# Altium project RF-Hub-v1.0.PrjPcb (part 1 of 4)
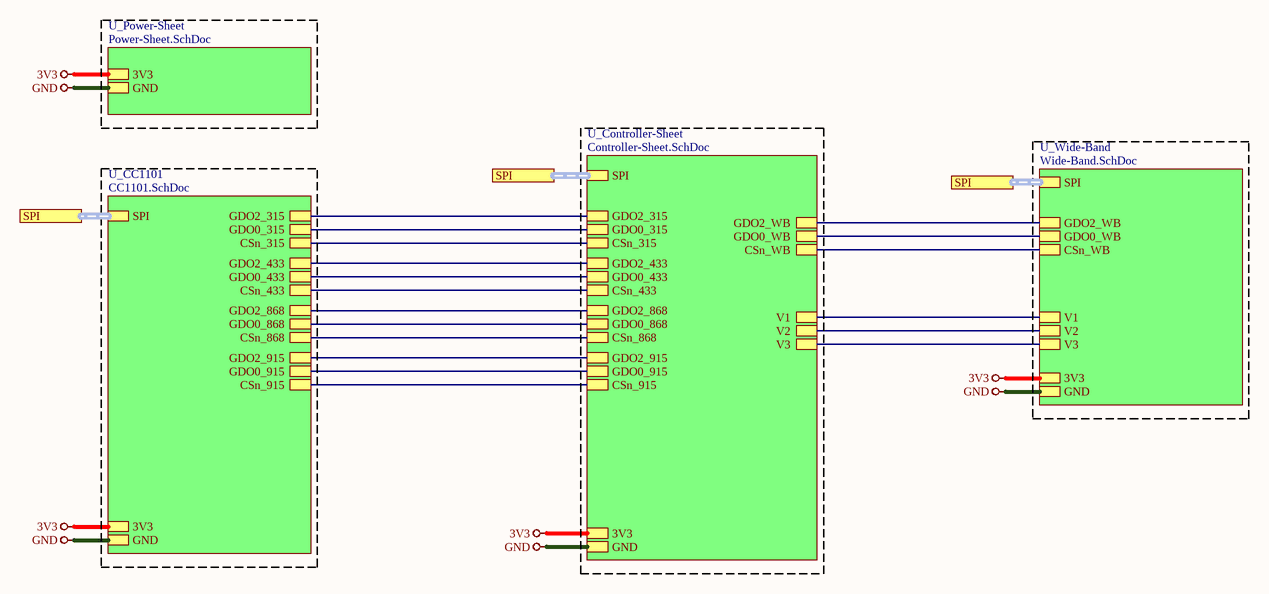
[diagram p0: Top-Sheet.SchDoc]
5 sheets, 211 parts. Net scope: hierarchical (ports join the sheet entries above them; power ports are global).
Sheets:
  Top-Sheet.SchDoc
    U_CC1101 = CC1101.SchDoc
    U_Controller-Sheet = Controller-Sheet.SchDoc
    U_Power-Sheet = Power-Sheet.SchDoc
    U_Wide-Band = Wide-Band.SchDoc

## Sheet Top-Sheet.SchDoc
size A4; SheetNumber: 1; SheetTotal: 5

### Sub-sheets
U_CC1101 = CC1101.SchDoc: SPI (harness SPI), GDO2_315, GDO0_315, CSn_315, GDO2_433, GDO0_433, CSn_433, GDO2_868, GDO0_868, CSn_868, GDO2_915, GDO0_915, CSn_915, 3V3, GND
U_Controller-Sheet = Controller-Sheet.SchDoc: GDO2_315, GDO0_315, CSn_315, GDO2_433, GDO0_433, CSn_433, GDO2_868, GDO0_868, CSn_868, GDO2_915, GDO0_915, CSn_915, 3V3, GND, GDO2_WB, GDO0_WB, CSn_WB, V1, V2, V3, SPI (harness SPI)
U_Power-Sheet = Power-Sheet.SchDoc: 3V3, GND
U_Wide-Band = Wide-Band.SchDoc: SPI (harness SPI), GDO2_WB, GDO0_WB, CSn_WB, V1, V2, V3, 3V3, GND

### Ports
SPI

### Nets
3V3: sheet U_CC1101/3V3, sheet U_Controller-Sheet/3V3, sheet U_Power-Sheet/3V3, sheet U_Wide-Band/3V3
GND: sheet U_CC1101/GND, sheet U_Controller-Sheet/GND, sheet U_Power-Sheet/GND, sheet U_Wide-Band/GND
CSn_315: sheet U_CC1101/CSn_315, sheet U_Controller-Sheet/CSn_315
CSn_433: sheet U_CC1101/CSn_433, sheet U_Controller-Sheet/CSn_433
CSn_868: sheet U_CC1101/CSn_868, sheet U_Controller-Sheet/CSn_868
CSn_915: sheet U_CC1101/CSn_915, sheet U_Controller-Sheet/CSn_915
CSn_WB: sheet U_Controller-Sheet/CSn_WB, sheet U_Wide-Band/CSn_WB
GDO0_315: sheet U_CC1101/GDO0_315, sheet U_Controller-Sheet/GDO0_315
GDO0_433: sheet U_CC1101/GDO0_433, sheet U_Controller-Sheet/GDO0_433
GDO0_868: sheet U_CC1101/GDO0_868, sheet U_Controller-Sheet/GDO0_868
GDO0_915: sheet U_CC1101/GDO0_915, sheet U_Controller-Sheet/GDO0_915
GDO0_WB: sheet U_Controller-Sheet/GDO0_WB, sheet U_Wide-Band/GDO0_WB
GDO2_315: sheet U_CC1101/GDO2_315, sheet U_Controller-Sheet/GDO2_315
GDO2_433: sheet U_CC1101/GDO2_433, sheet U_Controller-Sheet/GDO2_433
GDO2_868: sheet U_CC1101/GDO2_868, sheet U_Controller-Sheet/GDO2_868
GDO2_915: sheet U_CC1101/GDO2_915, sheet U_Controller-Sheet/GDO2_915
GDO2_WB: sheet U_Controller-Sheet/GDO2_WB, sheet U_Wide-Band/GDO2_WB
V1: sheet U_Controller-Sheet/V1, sheet U_Wide-Band/V1
V2: sheet U_Controller-Sheet/V2, sheet U_Wide-Band/V2
V3: sheet U_Controller-Sheet/V3, sheet U_Wide-Band/V3

### Buses and harness runs
harness port SPI = sheet U_CC1101/SPI
harness port SPI = sheet U_Controller-Sheet/SPI
harness port SPI = sheet U_Wide-Band/SPI

### Notes on the sheet
- File:
- Title:
- Date:
- Page
- Num:
- Total:
- Drawn By: Huzaifa Ali